# Altium schematic sheet Sensor2_ICM-42688-P.SchDoc: Sensors - IMU 2 ICM-42688-P (SPI5)
size A3; ApprovedBy: Weymen Koo; CheckedBy: -; DrawnBy: Weymen Koo; DocumentNumber: UBCAD-FCSOM-SCH; Revision: A; SheetNumber: 7; SheetTotal: 18; ProjectTitle: Flight Controller SoM; Status: PRELIMINARY; ReleaseDate: 2026-11-14
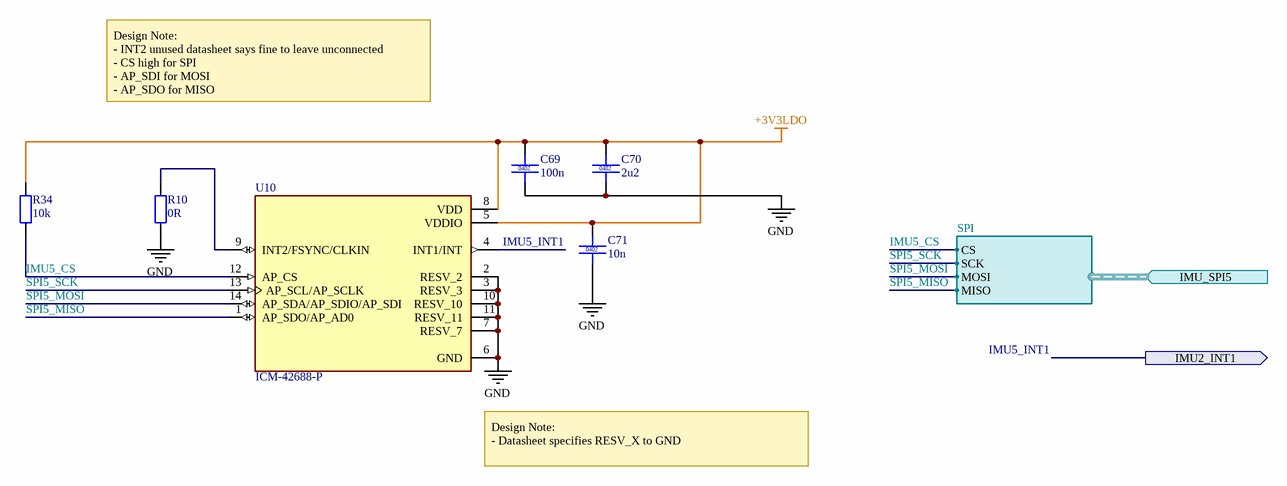
[diagram p0: Sensor2_ICM-42688-P.SchDoc]

## Parts
C69  100n  [CAPC1005X05N]
C70  2u2  [CAPC1005X05N]
C71  10n  [CAPC1005X05N]
R10  0R  [IPC C R0402 NO SILK]
R34  10k  [IPC C R0402 NO SILK]
U10  ICM-42688-P  [PQFN50P300X250X97-14N]

## Ports
IMU2_INT1 (out, see 1[5B], 4[9B]), IMU_SPI5 (in, harness SPI, see 1[5B], 4[9C])

## Harnesses
SPI: CS, SCK, MOSI, MISO

## Nets
+3V3LDO: C69.1 C70.1 C71.1 R34.2 U10.5(VDDIO) U10.8(VDD)
GND: C69.2 C70.2 C71.2 R10.1 U10.2(RESV_2) U10.3(RESV_3) U10.6(GND) U10.7(RESV_7) U10.10(RESV_10) U10.11(RESV_11)
IMU5_CS: R34.1 U10.12(AP_CS) ; port IMU_SPI5.CS
IMU5_INT1: U10.4(INT1/INT) ; port IMU2_INT1
SPI5_MISO: U10.1(AP_SDO/AP_AD0) ; port IMU_SPI5.MISO
SPI5_MOSI: U10.14(AP_SDA/AP_SDIO/AP_SDI) ; port IMU_SPI5.MOSI
SPI5_SCK: U10.13(AP_SCL/AP_SCLK) ; port IMU_SPI5.SCK
NetR10_2: R10.2 U10.9(INT2/FSYNC/CLKIN)

## Notes on the sheet
- Design Note:
  - INT2 unused datasheet says fine to leave unconnected
  - CS high for SPI
  - AP_SDI for MOSI
  - AP_SDO for MISO
- Design Note:
  - Datasheet specifies RESV_X to GND
- PROJECT
- KEY
- POWER
- 5 V class
- 3.3 V class
- Core / SMPS
- GND
- SHEET TITLE
- SIGNALS
- NOTES
- SPI
- Analog
- Design
- I2C
- PWM/Timer
- Layout
- UART/RC
- GPIO/Ctrl
- Assembly
- CAN
- Unused pin
- Firmware
- USB/SD/Clk
- Critical
- DRAWN
- DOCUMENT NO.
- CHECKED
- REV
- STATUS
- APPROVED
- DATE
- FILE
- SIZE
- A3
- SHEET
- of

## Library data of the parts
C69 = CMP-002-000094-5: CAP 100n 16V X7R 10% 0402; Manufacturer: Samsung; Manufacturer Part Number: CL05B104KO5NNNC; Value: 100n; Tolerance: 10%; Package: 0402; Voltage: 16V; Dielectric: X7R; LCSC Part #: C1525
C70 = CMP-002-000094-5: CAP 2u2 6.3V X5R 20% 0402; Manufacturer: Samsung; Manufacturer Part Number: CL05A225MQ5NSNC; Value: 2u2; Tolerance: 20%; Package: 0402; Voltage: 6.3V; Dielectric: X5R; LCSC Part #: C12530
C71 = CMP-002-000094-5: CAP 10n 50V X7R 10% 0402; Manufacturer: Samsung; Manufacturer Part Number: CL05B103KB5NNNC; Value: 10n; Tolerance: 10%; Package: 0402; Voltage: 50V; Dielectric: X7R; LCSC Part #: C15195
R10 = CMP-008-000000-2: RES 0R 1% 1/16W 0402; Manufacturer: UNI-ROYAL; Manufacturer Part Number: 0402WGF0000TCE; Value: 0R; Source: Schlib1.SchLib; Design Item ID: Generic RES 0402; Package: 0402; Tolerance: 1%; Power: 1/16W; LCSC Part #: C17168
R34 = CMP-008-000000-2: RES 10k 1% 1/16W 0402; Manufacturer: UNI-ROYAL; Manufacturer Part Number: 0402WGF1002TCE; Value: 10k; Source: Schlib1.SchLib; Design Item ID: Generic RES 0402; Package: 0402; Tolerance: 1%; Power: 1/16W; LCSC Part #: C25744
U10 = CMP-195-000000-1: Accelerometer, Gyroscope, 6 Axis Sensor Output; Value: *; Component Type: Standard; Price: None; MP: ICM-42688-P; Design Item ID: ICM-42688-P; Package: None; Availability: Unavailable; Pin Count: 14; Source: ICM-42688-P.SchLib